# Altium schematic sheet Connector-Sheet.SchDoc
size A4; SheetNumber: 3; SheetTotal: 3
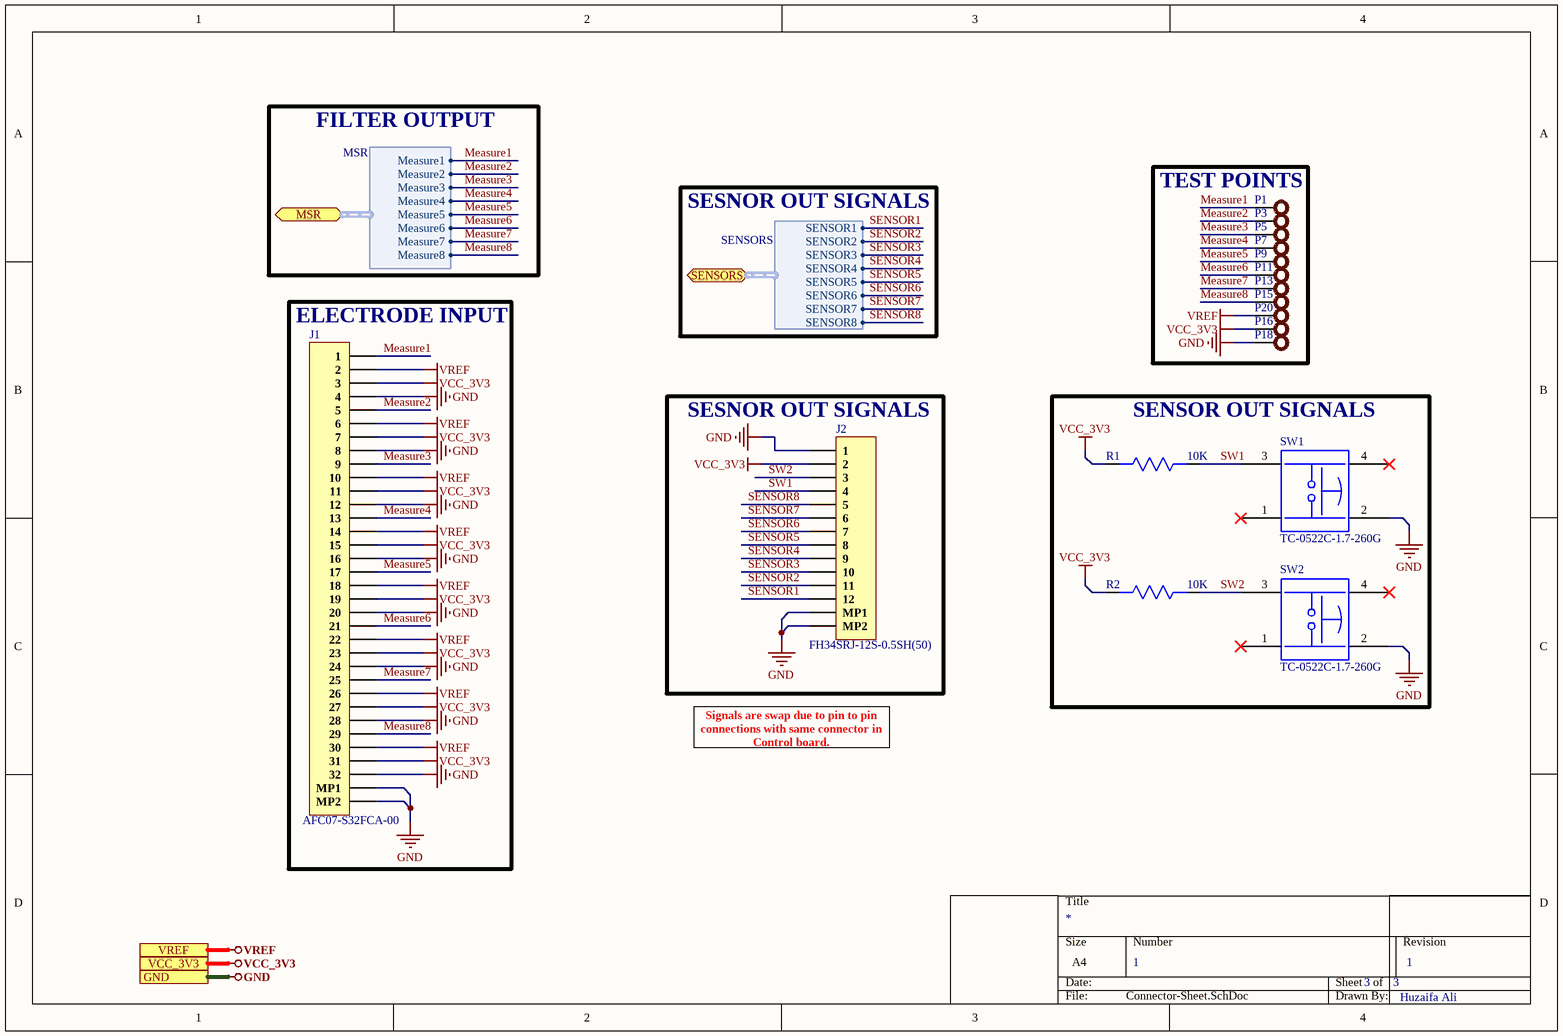
[diagram p0: Connector-Sheet.SchDoc]

## Parts
J1  AFC07-S32FCA-00  [AFC07-S32FCA-00]
J2  FH34SRJ-12S-0.5SH(50)  [FH34SRJ-12S-0.5SH(50)]
P1  Test Point  [TEST POINT]  (value not drawn)
P3  Test Point  [TEST POINT]  (value not drawn)
P5  Test Point  [TEST POINT]  (value not drawn)
P7  Test Point  [TEST POINT]  (value not drawn)
P9  Test Point  [TEST POINT]  (value not drawn)
P11  Test Point  [TEST POINT]  (value not drawn)
P13  Test Point  [TEST POINT]  (value not drawn)
P15  Test Point  [TEST POINT]  (value not drawn)
P16  Test Point  [TEST POINT]  (value not drawn)
P18  Test Point  [TEST POINT]  (value not drawn)
P20  Test Point  [TEST POINT]  (value not drawn)
R1  10K  [Res0402]
R2  10K  [Res0402]
SW1  TC-0522C-1.7-260G  [TC-0522C-1.7-260G]
SW2  TC-0522C-1.7-260G  [TC-0522C-1.7-260G]

## Blocks framed on the sheet
TEST POINTS: P1 P3 P5 P7 P9 P11 P13 P15 P16 P18 P20
ELECTRODE INPUT: J1
SESNOR OUT SIGNALS: J2
SENSOR OUT SIGNALS: R1 R2 SW1 SW2

## Ports
GND, MSR (bidir, harness MSR), SENSORS (bidir, harness SENSORS), VCC_3V3, VREF

## Harnesses
SENSORS: SENSOR1, SENSOR2, SENSOR3, SENSOR4, SENSOR5, SENSOR6, SENSOR7, SENSOR8
MSR: Measure1, Measure2, Measure3, Measure4, Measure5, Measure6, Measure7, Measure8

## Nets
GND: J1.4 J1.8 J1.12 J1.16 J1.20 J1.24 J1.28 J1.32 J1.MP1 J1.MP2 J2.1 J2.MP1 J2.MP2 P18.1 SW1.2 SW2.2 ; port GND
VCC_3V3: J1.3 J1.7 J1.11 J1.15 J1.19 J1.23 J1.27 J1.31 J2.2 P16.1 R1.2 R2.2 ; port VCC_3V3
VREF: J1.2 J1.6 J1.10 J1.14 J1.18 J1.22 J1.26 J1.30 P20.1 ; port VREF
Measure1: J1.1 P1.1 ; port MSR.Measure1
Measure2: J1.5 P3.1 ; port MSR.Measure2
Measure3: J1.9 P5.1 ; port MSR.Measure3
Measure4: J1.13 P7.1 ; port MSR.Measure4
Measure5: J1.17 P9.1 ; port MSR.Measure5
Measure6: J1.21 P11.1 ; port MSR.Measure6
Measure7: J1.25 P13.1 ; port MSR.Measure7
Measure8: J1.29 P15.1 ; port MSR.Measure8
SENSOR1: J2.12 ; port SENSORS.SENSOR1
SENSOR2: J2.11 ; port SENSORS.SENSOR2
SENSOR3: J2.10 ; port SENSORS.SENSOR3
SENSOR4: J2.9 ; port SENSORS.SENSOR4
SENSOR5: J2.8 ; port SENSORS.SENSOR5
SENSOR6: J2.7 ; port SENSORS.SENSOR6
SENSOR7: J2.6 ; port SENSORS.SENSOR7
SENSOR8: J2.5 ; port SENSORS.SENSOR8
SW1: J2.4 R1.1 SW1.3
SW2: J2.3 R2.1 SW2.3

Not connected (* = marked no-connect by the designer): SW1 1* 4*; SW2 1* 4*

## Notes on the sheet
- FILTER OUTPUT
- SESNOR OUT SIGNALS
- Signals are swap due to pin to pin connections with same connector in Control board.
- 1
- Huzaifa Ali

## Library data of the parts
J1 = AFC07-S32FCA-00: Slide Lock 32 Bottom Contact Surface Mount 0.5mm SMD,P=0.5mm FFC/FPC Connectors ROHS; Manufacturer: JUSHUO; Manufacturer Part Number: AFC07-S32FCA-00; Footprint: Custom; ComponentLink1Description: LCSC; ComponentLink1URL: https://lcsc.com/product-detail/FFC-FPC-Connectors_JUSHUO-AFC07-S32FCA-00_C262570.html
J2 = FH34SRJ-12S-0.5SH(50): CONN FPC/FFC 12POS .5MM; Manufacturer: Hirose; Supplier 1: Digi-Key; Manufacturer Part Number: FH34SRJ-12S-0.5SH(50); RoHS: Yes; Category: FFC / FPC; Pricing 1: 5000=0.47775 (USD); ComponentLink1URL: https://www.hirose.com/product/en/download_file/key_name/FH34SRJ/category/Catalog/doc_file_id/31646/?file_category_id=4&item_id=27&is_series=1&src-supplier=Digi-Key; ComponentLink1Description: https://www.hirose.com/product/en/download_file/key_name/FH34SRJ/category/Catalog/doc_file_id/31646/?file_category_id=4&item_id=27&is_series=1&src-supplier=Digi-Key; Supplier Part Number 1: FH34SRJ-12S-0.5SH(50)-ND
P1 P3 P5 P7 P9 P11 P13 P15 P16 P18 P20 = TEST POINT: Test Point ON
R1 R2 = RC0402FR-0710KL: RES SMD 10K OHM 1% 1/16W 0402; Manufacturer: Yageo; Resistance: 10kR; Temperature Coefficient: 100ppm/°C; Voltage Rating (DC): 50V; Power Rating: 62.5mW; Supplier 1: Digi-Key; Manufacturer Part Number: RC0402FR-0710KL; Stock 1: 60122563; Pricing 1: 1=0.1, 10=0.016, 100=0.0064, 1000=0.00289, 2500=0.00251, 5000=0.00207 (USD); Case/Package: 0402; Number of Pins: 2; Case Code (Imperial): 0402; Case Code (Metric): 1005; Min Operating Temperature: -55°C; Max Operating Temperature: 155°C; Composition: Thick Film; Tolerance: 1%; Packaging: Tape and Reel; Voltage Rating: 50V; Termination: SMD/SMT; Military Standard: Not; Working Voltage: 50V; Number of Terminations: 2; Length: 1mm; Height: 0.32mm; Width: 0.5mm; Depth: 0.5mm; Lead Pitch: 0.2mm; REACH SVHC: No SVHC; Lead Free: Lead Free; ComponentLink1URL: http://www.farnell.com/datasheets/2167052.pdf?src-supplier=Element14; ComponentLink1Description: http://www.farnell.com/datasheets/2167052.pdf?src-supplier=Element14; ComponentLink2URL: http://www.farnell.com/datasheets/1686128.pdf?src-supplier=Element14; ComponentLink2Description: http://www.farnell.com/datasheets/1686128.pdf?src-supplier=Element14; ComponentLink3URL: http://www.farnell.com/datasheets/1784430.pdf?src-supplier=Element14; ComponentLink3Description: http://www.farnell.com/datasheets/1784430.pdf?src-supplier=Element14; ComponentLink4URL: http://www.yageo.com/documents/recent/PYu-RC_Group_51_RoHS_L_9.pdf?src-supplier=Mouser; ComponentLink4Description: http://www.yageo.com/documents/recent/PYu-RC_Group_51_RoHS_L_9.pdf?src-supplier=Mouser; Supplier Part Number 1: 311-10.0KLRDKR-ND
SW1 SW2 = TC-0522C-1.7-260G: No Gull Wing 50mA 100MΩ 80000 260gf@±50gf 12V -25℃~+85℃ 1.7mm Golden Round Button Brick nogging SPST SMD Tactile Switches ROHS; Manufacturer: HCTL; Manufacturer Part Number: TC-0522C-1.7-260G; Value: -; Footprint: Custom; ComponentLink1Description: LCSC; ComponentLink1URL: https://www.lcsc.com/product-detail/Tactile-Switches_HCTL-TC-0522C-1-7-260G_C2845290.html